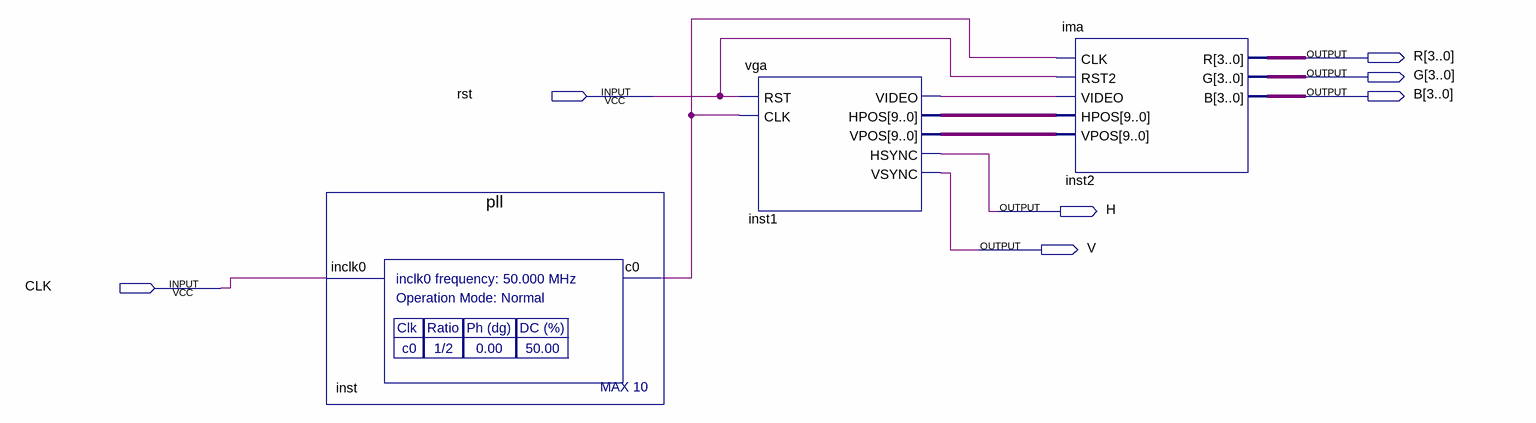
[diagram p0: schematic sheet]
// Quartus schematic P9.bdf as structural Verilog: 3 symbols, 7 pins
module P9 (
  input  rst,
  input  CLK,
  output [3:0] R,
  output [3:0] G,
  output [3:0] B,
  output H,
  output V
);

  wire inst1_video, inst_c0;
  wire [9:0] inst1_hpos, inst1_vpos;

  pll inst (.inclk0(CLK), .c0(inst_c0));
  vga inst1 (.RST(rst), .CLK(inst_c0), .VIDEO(inst1_video), .HPOS(inst1_hpos), .VPOS(inst1_vpos), .HSYNC(H), .VSYNC(V));
  ima inst2 (.CLK(inst_c0), .RST2(rst), .VIDEO(inst1_video), .HPOS(inst1_hpos), .VPOS(inst1_vpos), .R(R), .G(G), .B(B));
endmodule
